# Altium schematic sheet b2b_ant_plate.SchDoc: Наименование
size 594 x 420 mm; ApprovedBy: Утвердил; CheckedBy: Проверил; Author: Разработал; CompanyName: ВлГУ; DrawnBy: Н.Контр; Engineer: Т.Контр; SheetNumber: 6; SheetTotal: 9; PageSetup: Record=PageOptions|CenterHorizontal=True|CenterVertical=True|PrintScale=0.94|XCorrection=1.00|YCorrection=1.00|PrintKind=1|BorderSize=5000000|LeftOffset=0|BottomOffset=0|Orientation=1|PaperLength=1000|PaperWidth=1000|Scale=100|PaperSource=7|PrintQuality=-4|MediaType=1|DitherType=10|PaperKind=A4|PrintScaleMode=1; DecimalNumber: Децимальный номер; HeadOfSector: Нач. сектора; MainDevice: Перв.примен.; Name: Наименование; DocumentName: Sheet1.SCHDOC
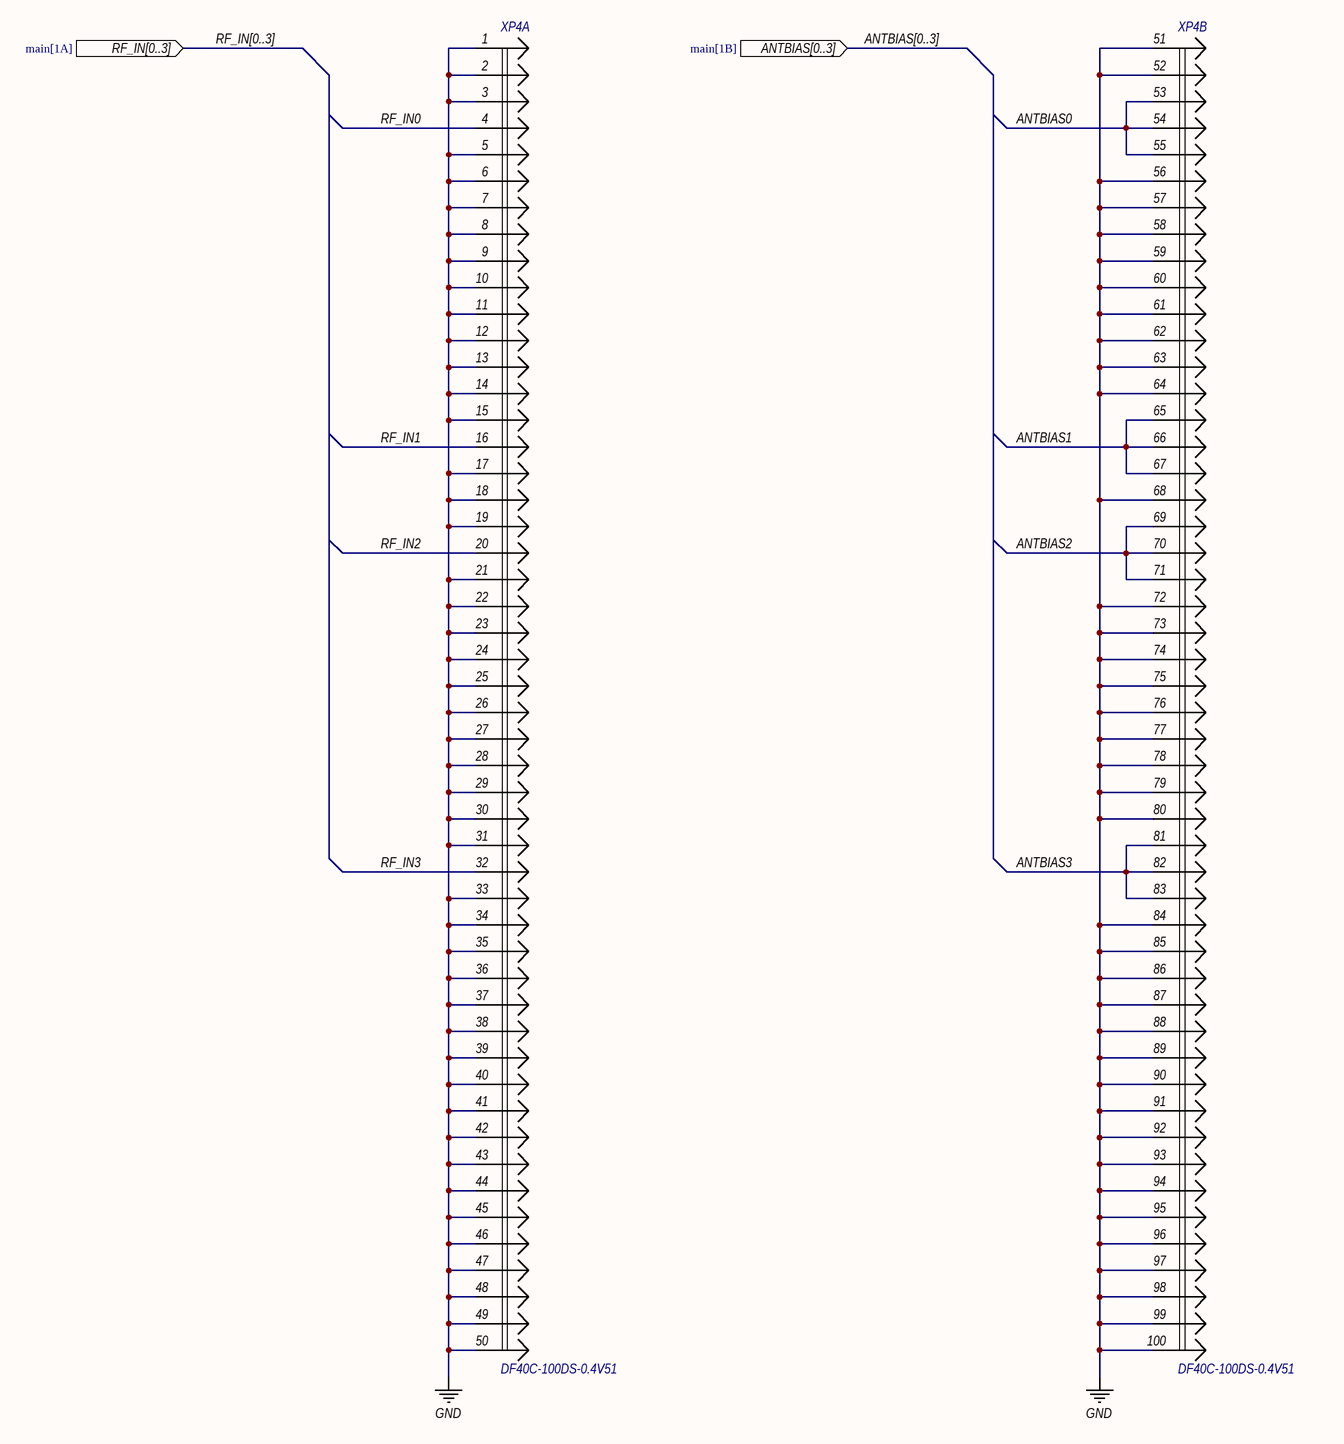
[diagram p0: b2b_ant_plate.SchDoc]

## Parts
XP4  DF40C-100DS-0.4V51  [CONN_DF40C-100DS-0.4V51_HIR]  (parts A,B of 2)

## Ports
ANTBIAS[0..3] (in, see main[1B]), RF_IN[0..3] (in, see main[1A])

## Nets
GND: XP4.1 XP4.2 XP4.3 XP4.5 XP4.6 XP4.7 XP4.8 XP4.9 XP4.10 XP4.11 XP4.12 XP4.13 XP4.14 XP4.15 XP4.17 XP4.18 XP4.19 XP4.21 XP4.22 XP4.23 XP4.24 XP4.25 XP4.26 XP4.27 XP4.28 XP4.29 XP4.30 XP4.31 XP4.33 XP4.34 XP4.35 XP4.36 XP4.37 XP4.38 XP4.39 XP4.40 XP4.41 XP4.42 XP4.43 XP4.44 XP4.45 XP4.46 XP4.47 XP4.48 XP4.49 XP4.50 XP4.51 XP4.52 XP4.56 XP4.57 XP4.58 XP4.59 XP4.60 XP4.61 XP4.62 XP4.63 XP4.64 XP4.68 XP4.72 XP4.73 XP4.74 XP4.75 XP4.76 XP4.77 XP4.78 XP4.79 XP4.80 XP4.84 XP4.85 XP4.86 XP4.87 XP4.88 XP4.89 XP4.90 XP4.91 XP4.92 XP4.93 XP4.94 XP4.95 XP4.96 XP4.97 XP4.98 XP4.99 XP4.100
ANTBIAS0: XP4.53 XP4.54 XP4.55
ANTBIAS1: XP4.65 XP4.66 XP4.67
ANTBIAS2: XP4.69 XP4.70 XP4.71
ANTBIAS3: XP4.81 XP4.82 XP4.83
RF_IN0: XP4.4
RF_IN1: XP4.16
RF_IN2: XP4.20
RF_IN3: XP4.32

## Buses and harness runs
bus ANTBIAS[0..3] = port ANTBIAS[0..3]
bus RF_IN[0..3] = port RF_IN[0..3]

## Notes on the sheet
- Подп. и дата
- Инв.№ дубл.
- Взам.инв.№
- Подп.и дата
- Инв.№ подл.
- Изм.
- Лист
- № докум.
- Подп.
- Дата
- Формат  A2

## Library data of the parts
XP4 = DF40C-100DS-0.4V51: DF40C 100 pin socket; Part number: DF40C-100DS-0.4V51